# Altium schematic sheet 04_Interfaces_Audio.SchDoc: Portable_Guitar_MultiFX
size A4; Organization: Altium Limited; Address1: L3, 12a Rodborough Rd; Address2: Frenchs Forest; Address3: NSW; Address4: Australia 2086; DocumentNumber: 1; SheetNumber: 5; SheetTotal: 5
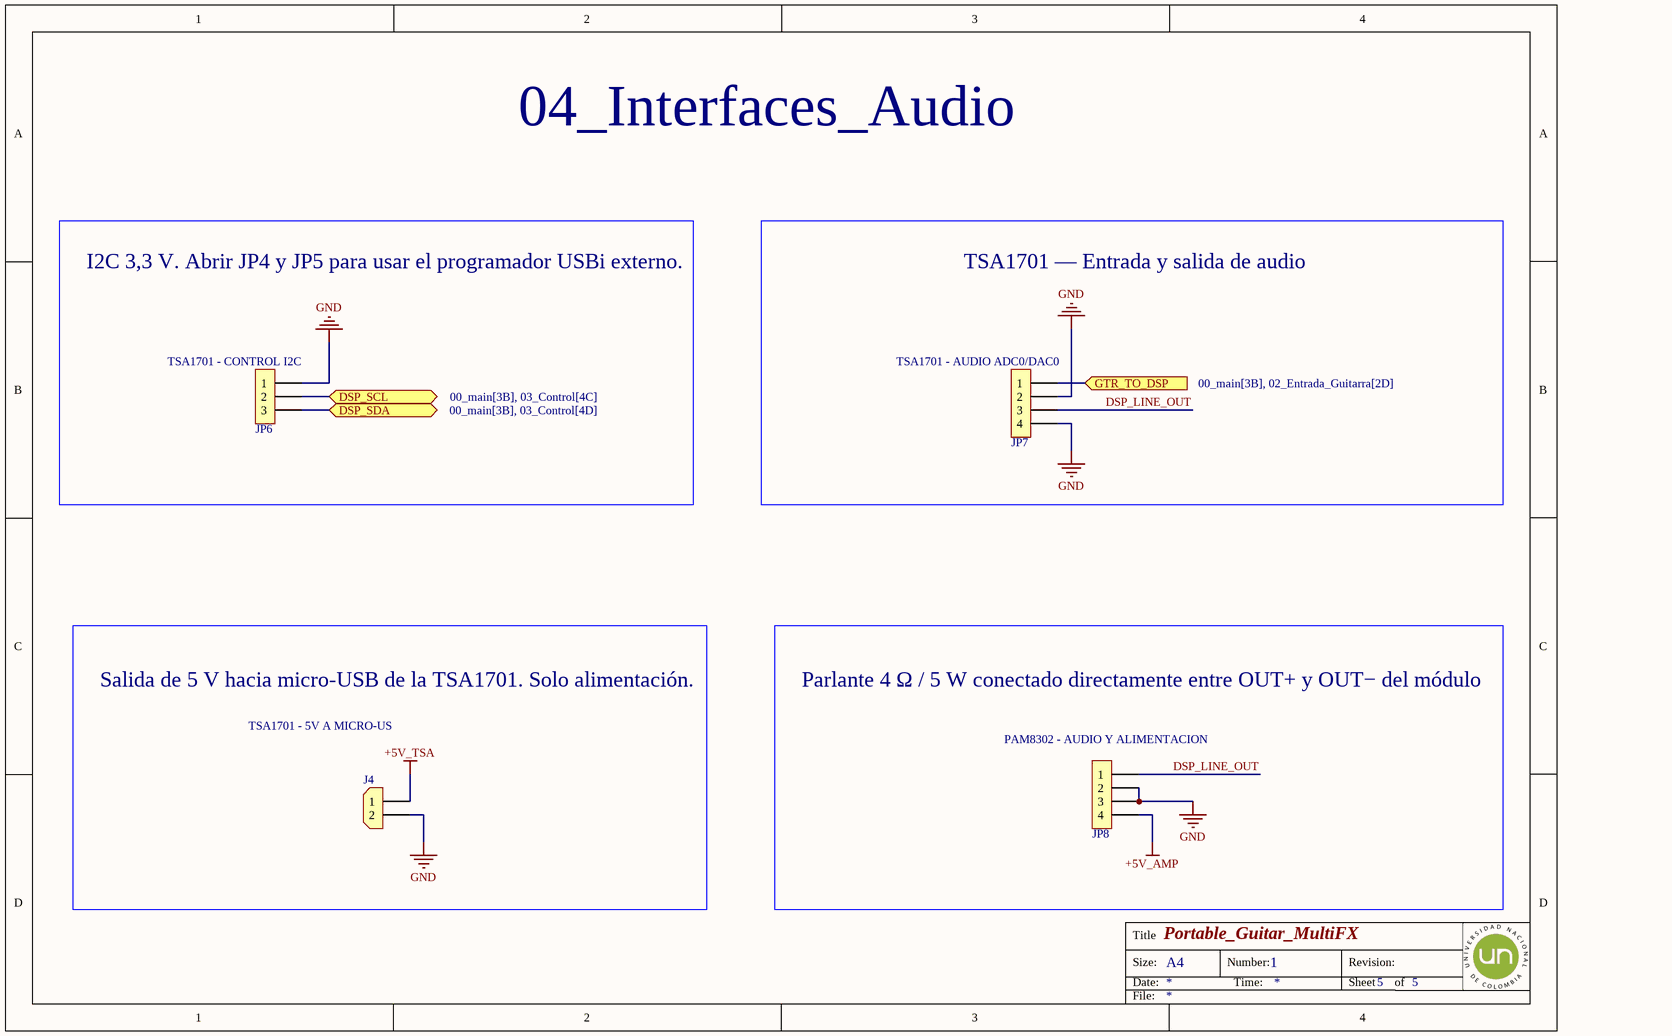
[diagram p0: 04_Interfaces_Audio.SchDoc]

## Parts
J4  TSA1701 - 5V A MICRO-US  [CON_2x1_TH_2MM]
JP6  TSA1701 - CONTROL I2C  [H_3X1_TH_100mil]  (no BOM)
JP7  TSA1701 - AUDIO ADC0/DAC0  [H_4x1_TH_2.54mm]  (no BOM)
JP8  PAM8302 - AUDIO Y ALIMENTACION  [H_4x1_TH_2.54mm]  (no BOM)

## Blocks framed on the sheet
TSA1701 — Entrada y salida de audio: JP7

## Ports
DSP_SCL (bidir, see 00_main[3B], 03_Control[4C]), DSP_SDA (bidir, see 00_main[3B], 03_Control[4D]), GTR_TO_DSP (in, see 00_main[3B], 02_Entrada_Guitarra[2D])

## Nets
+5V_AMP: JP8.4
+5V_TSA: J4.1
GND: J4.2 JP6.1 JP7.2 JP7.4 JP8.2 JP8.3
DSP_LINE_OUT: JP7.3 JP8.1
DSP_SCL: JP6.2 ; port DSP_SCL
DSP_SDA: JP6.3 ; port DSP_SDA
GTR_TO_DSP: JP7.1 ; port GTR_TO_DSP

## Notes on the sheet
- 04_Interfaces_Audio
- I2C 3,3 V. Abrir JP4 y JP5 para usar el programador USBi externo.
- Salida de 5 V hacia micro-USB de la TSA1701. Solo alimentación.
- Parlante 4 Ω / 5 W conectado directamente entre OUT+ y OUT− del módulo
- Title
- Size:
- Date:
- A4
- Number:
- Time:
- Revision:
- Sheet
- of
- File:

## Library data of the parts
J4 = Con_2x1_TH_JST_2MM: 2POS 2MM; Manufacturer: JST; Manufacturer Part Number: S2B-PH-K-S(LF)(SN); Supplier 1: LCSC; Supplier Part Number 1: C173752; ComponentLink1Description: Digi-Key; ComponentLink1URL: https://lcsc.com/product-detail/Wire-To-Board-Connector_JST-S2B-PH-K-S-LF-SN_C173752.html
JP6 = H_Male_3x1_TH_100mil: ComponentLink1Description: LCSC
JP7 JP8 = H_Male_4x1_TH_100mil: ComponentLink1Description: LCSC